# EAGLE schematic source_eagle (EAGLE 9.6.2)

## Sheet 1 of 2
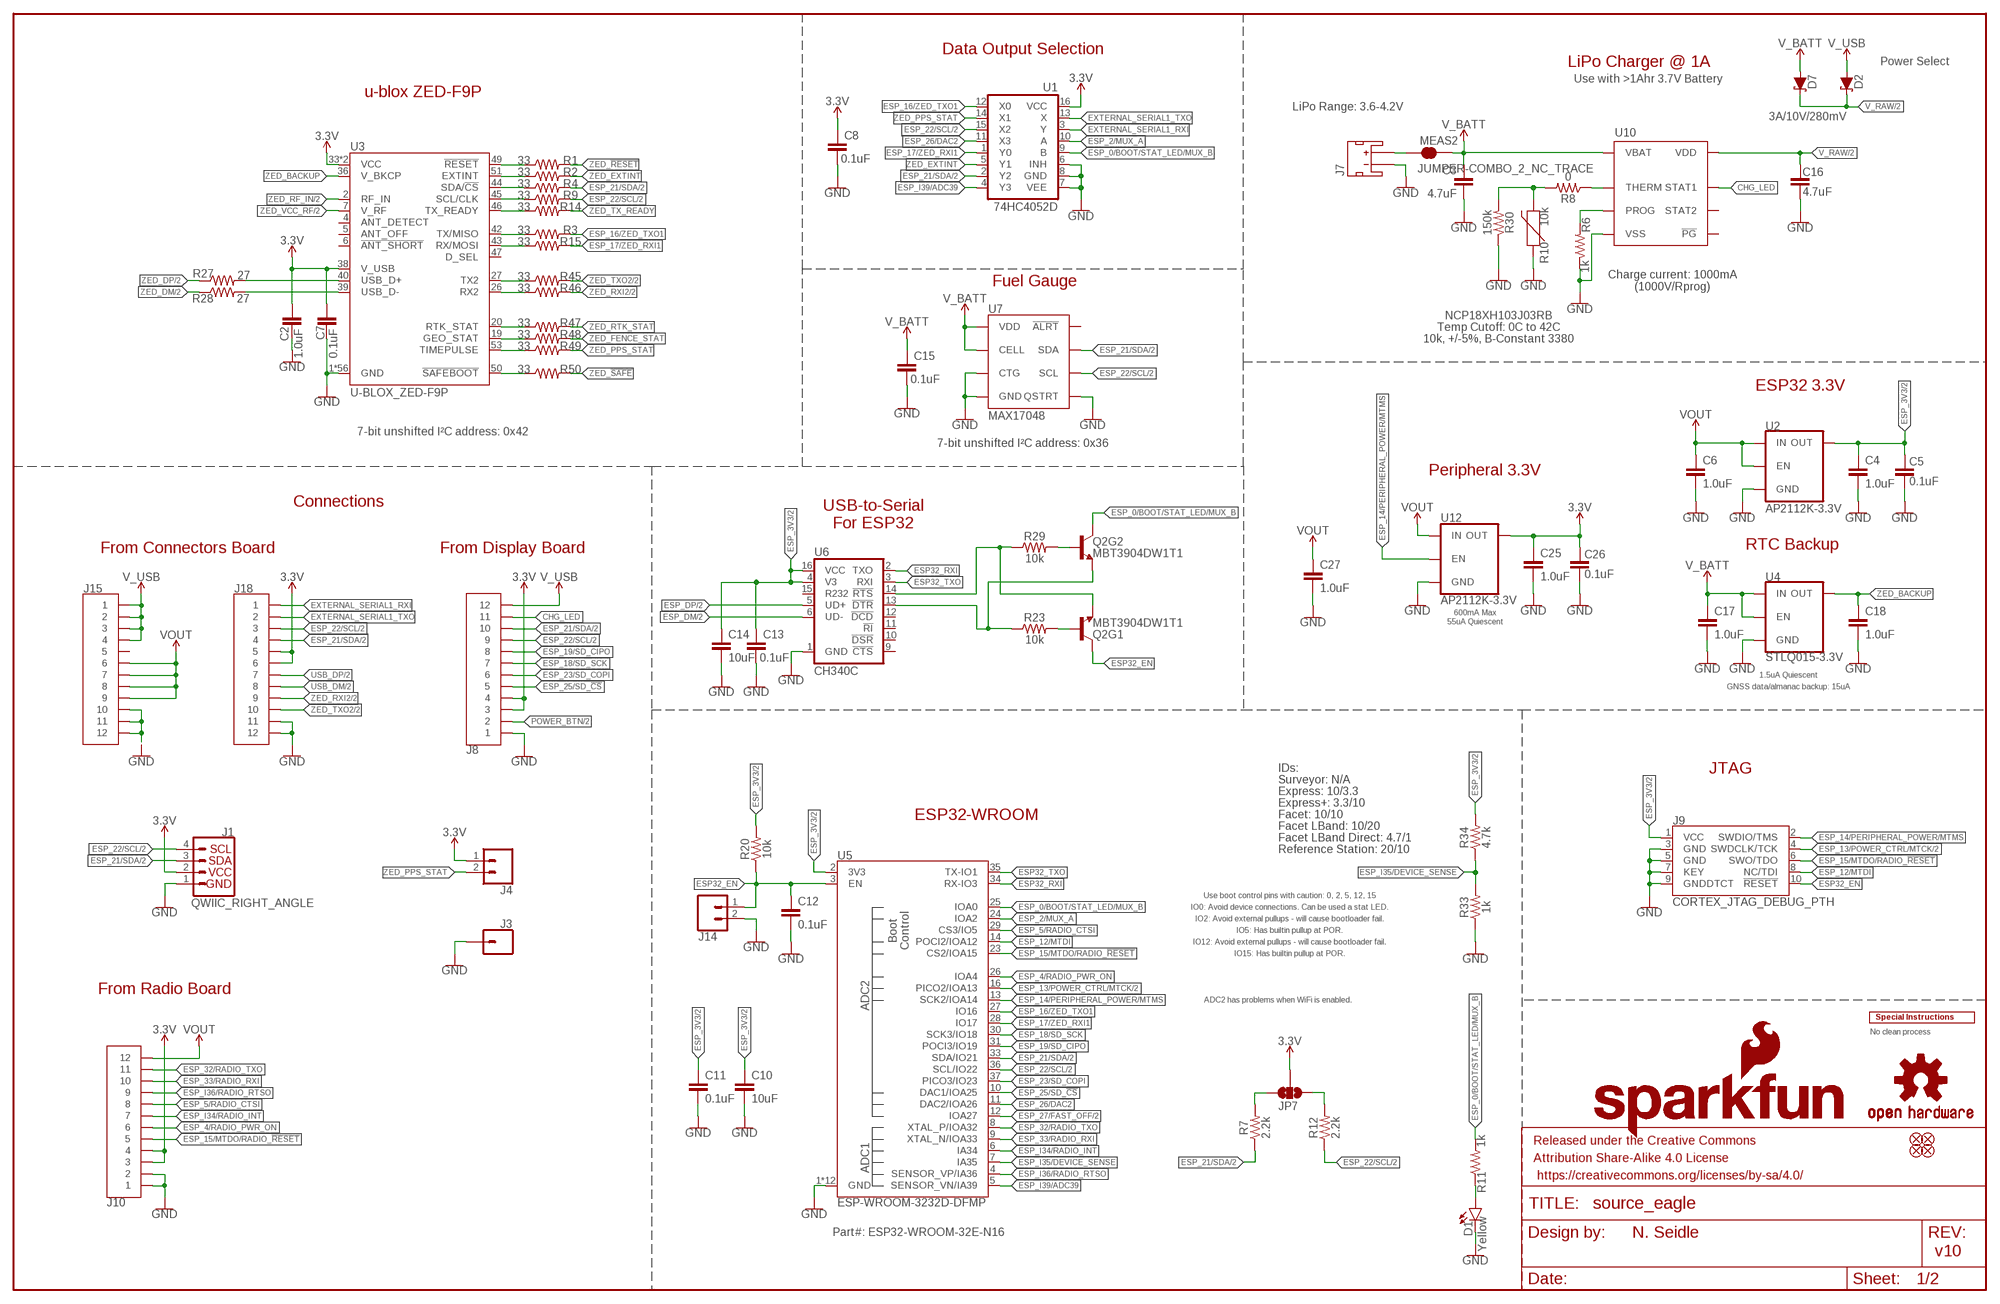
[diagram p0: schematic, sheet 1]

### Parts
C2  1.0uF  1.0UF-0603-16V-10%-X7R  [0603]
C3  4.7uF  4.7UF-0603-35V-(20%)  [0603]
C4  1.0uF  1.0UF-0603-16V-10%-X7R  [0603]
C5  0.1uF  0.1UF-0603-25V-5%  [0603]
C6  1.0uF  1.0UF-0603-16V-10%-X7R  [0603]
C7  0.1uF  0.1UF-0603-25V-5%  [0603]
C8  0.1uF  0.1UF-0603-25V-(+80/-20%)  [0603]
C10  10uF  10UF-0603-6.3V-20%  [0603]
C11  0.1uF  0.1UF-0603-25V-(+80/-20%)  [0603]
C12  0.1uF  0.1UF-0603-25V-(+80/-20%)  [0603]
C13  0.1uF  0.1UF-0603-25V-(+80/-20%)  [0603]
C14  10uF  10UF-0603-6.3V-20%  [0603]
C15  0.1uF  0.1UF-0603-25V-(+80/-20%)  [0603]
C16  4.7uF  4.7UF-0603-35V-(20%)  [0603]
C17  1.0uF  1.0UF-0603-16V-10%-X7R  [0603]
C18  1.0uF  1.0UF-0603-16V-10%-X7R  [0603]
C25  1.0uF  1.0UF-0603-16V-10%-X7R  [0603]
C26  0.1uF  0.1UF-0603-25V-5%  [0603]
C27  1.0uF  1.0UF-0603-16V-10%-X7R  [0603]
D1  Yellow  LED-YELLOW0603  [LED-0603]
D2  3A/10V/280mV  DIODE-SCHOTTKY-BAT60A  [SOD-323]
D7  3A/10V/280mV  DIODE-SCHOTTKY-BAT60A  [SOD-323]
FRAME2  FRAME-LEDGER  [CREATIVE_COMMONS]
J1  QWIIC_RIGHT_ANGLE  QWIIC_CONNECTORJS-1MM  [JST04_1MM_RA]
J3  CONN_01PTH_NO_SILK_YES_STOP  [1X01_NO_SILK]
J4  CONN_021X02_NO_SILK  [1X02_NO_SILK]
J7  JST_2MM_MALE  [JST-2-SMD]
J8  FPC_12_0.5MM_BACKFLIP  [FPC_12_DOUBLESIDED_BACKFLIP]
J9  CORTEX_JTAG_DEBUG_PTH  [2X5-PTH-1.27MM]
J10  FPC_12_0.5MM_BACKFLIP  [FPC_12_DOUBLESIDED_BACKFLIP]
J14  CONN_021X02_NO_SILK  [1X02_NO_SILK]
J15  FPC_12_0.5MM_BACKFLIP  [FPC_12_DOUBLESIDED_BACKFLIP]
J18  FPC_12_0.5MM_BACKFLIP  [FPC_12_DOUBLESIDED_BACKFLIP]
JP7  JUMPER-SMT_3_NO_SILK  [SMT-JUMPER_3_NO_SILK]
JP21  FIDUCIALUFIDUCIAL  [FIDUCIAL-MICRO]
JP61  FIDUCIALUFIDUCIAL  [FIDUCIAL-MICRO]
JP71  FIDUCIALUFIDUCIAL  [FIDUCIAL-MICRO]
JP81  FIDUCIALUFIDUCIAL  [FIDUCIAL-MICRO]
LOGO1  OSHW-LOGOMINI  [OSHW-LOGO-MINI]
LOGO2  SFE_LOGO_NAME_FLAME.1_INCH  [SFE_LOGO_NAME_FLAME_.1]
MEAS2  JUMPER-COMBO_2_NC_TRACE  [COMBO-JUMPER_2_NC_TRACE]
Q2  MBT3904DW1T1  TRANS_NPN_DUAL-MBT3904DW1T1  [SC70-6]
R1  33  33OHM-0603-1/10W-1%  [0603]
R2  33  33OHM-0603-1/10W-1%  [0603]
R3  33  33OHM-0603-1/10W-1%  [0603]
R4  33  33OHM-0603-1/10W-1%  [0603]
R6  1k  1KOHM-0603-1/10W-1%  [0603]
R7  2.2k  2.2KOHM-0603-1/10W-1%  [0603]
R8  0  0OHM-0603-1/10W  [0603]
R9  33  33OHM-0603-1/10W-1%  [0603]
R10  10k  NTC-THERMISTOR-0603  [0603]
R11  1k  1KOHM-0603-1/10W-1%  [0603]
R12  2.2k  2.2KOHM-0603-1/10W-1%  [0603]
R14  33  33OHM-0603-1/10W-1%  [0603]
R15  33  33OHM-0603-1/10W-1%  [0603]
R20  10k  10KOHM-0603-1/10W-1%  [0603]
R23  10k  10KOHM-0603-1/10W-1%  [0603]
R27  27  27OHM-0603-1/10W-1%  [0603]
R28  27  27OHM-0603-1/10W-1%  [0603]
R29  10k  10KOHM-0603-1/10W-1%  [0603]
R30  150k  150KOHM-0603-1/10W-1%  [0603]
R33  1k  1KOHM-0603-1/10W-1%  [0603]
R34  4.7k  4.7KOHM-0603-1/10W-1%  [0603]
R45  33  33OHM-0603-1/10W-1%  [0603]
R46  33  33OHM-0603-1/10W-1%  [0603]
R47  33  33OHM-0603-1/10W-1%  [0603]
R48  33  33OHM-0603-1/10W-1%  [0603]
R49  33  33OHM-0603-1/10W-1%  [0603]
R50  33  33OHM-0603-1/10W-1%  [0603]
U1  74HC4052D  [SO16]
U2  AP2112K-3.3V  V_REG_AP2112K-3.3V  [SOT23-5]
U3  U-BLOX_ZED-F9P  [ZED-F9P]
U4  STLQ015-3.3V  [SOT23-5]
U5  ESP-WROOM-3232D-DFMP  [ESP-WROOM-32D-DFM_PASTE]
U6  CH340C  [SO016]
U7  MAX17048  MAX17048DFN8  [DFN-8]
U10  MCP73833MSOP  [MSOP10]
U12  AP2112K-3.3V  V_REG_AP2112K-3.3V  [SOT23-5]
U$2  SPECIAL_INSTRUCTIONS-ORDERING  [ORDERING_INSTRUCTIONS]

### Nets
3.3V [power]: C2.1 C7.2 C8.1 C25.1 C26.2 J1.2 J4.1 J8.3 J8.4 J10.3 J10.4 J18.5 J18.6 JP7.2 U1.16(VCC) U3.33(VCC) U3.34(VCC) U3.38(V_USB) U12.5(OUT) ; also sheet 2
CHG_LED: J8.11 U10.3(STAT1)
CHG_THERM1: R8.2 R10.2 R30.2
ESP32_!DTR: Q2.1(E) R23.1 U6.13(!DTR)
ESP32_!RTS: Q2.4(E) R29.1 U6.14(!RTS)
ESP32_EN: C12.1 J9.10(!RESET) J14.1 Q2.3(C) R20.1 U5.3(EN)
ESP32_RXI: U5.34(RX-IO3) U6.2(TXO)
ESP32_TXO: U5.35(TX-IO1) U6.3(RXI)
ESP_0/BOOT/STAT_LED/MUX_B: Q2.6(C) R11.2 U1.9(B) U5.25(IOA0)
ESP_2/MUX_A: U1.10(A) U5.24(IOA2)
ESP_3V3 [power]: C4.1 C5.2 C10.1 C11.1 C13.1 C14.1 J9.1(VCC) R20.2 R34.2 U2.5(OUT) U5.2(3V3) U6.4(V3) U6.16(VCC) ; also sheet 2
ESP_4/RADIO_PWR_ON: J10.6 U5.26(IOA4)
ESP_5/RADIO_CTSI: J10.8 U5.29(CS3/IO5)
ESP_12/MTDI: J9.8(NC/TDI) U5.14(POCI2/IOA12)
ESP_13/POWER_CTRL/MTCK: J9.4(SWDCLK/TCK) U5.16(PICO2/IOA13) ; also sheet 2
ESP_14/PERIPHERAL_POWER/MTMS: J9.2(SWDIO/TMS) U5.13(SCK2/IOA14) U12.3(EN)
ESP_15/MTDO/RADIO_!RESET!: J9.6(SWO/TDO) J10.5 U5.23(CS2/IOA15)
ESP_16/ZED_TXO1: R3.2 U1.12(X0) U5.27(IO16)
ESP_17/ZED_RXI1: R15.2 U1.1(Y0) U5.28(IO17)
ESP_18/SD_SCK: J8.7 U5.30(SCK3/IO18)
ESP_19/SD_CIPO: J8.8 U5.31(POCI3/IO19)
ESP_21/SDA: J1.3 J8.10 J18.4 R4.2 R7.1 U1.2(Y2) U5.33(SDA/IO21) U7.8(SDA) ; also sheet 2
ESP_22/SCL: J1.4 J8.9 J18.3 R9.2 R12.1 U1.15(X2) U5.36(SCL/IO22) U7.7(SCL) ; also sheet 2
ESP_23/SD_COPI: J8.6 U5.37(PICO3/IO23)
ESP_25/SD_!CS!: J8.5 U5.10(DAC1/IOA25)
ESP_26/DAC2: U1.11(X3) U5.11(DAC2/IOA26)
ESP_27/FAST_OFF: U5.12(IOA27) ; also sheet 2
ESP_32/RADIO_TXO: J10.11 U5.8(XTAL_P/IOA32)
ESP_33/RADIO_RXI: J10.10 U5.9(XTAL_N/IOA33)
ESP_DM [USB]: U6.6(UD-) ; also sheet 2
ESP_DP [USB]: U6.5(UD+) ; also sheet 2
ESP_I34/RADIO_INT: J10.7 U5.6(IA34)
ESP_I35/DEVICE_SENSE: R33.2 R34.1 U5.7(IA35)
ESP_I36/RADIO_RTSO: J10.9 U5.4(SENSOR_VP/IA36)
ESP_I39/ADC39: U1.4(Y3) U5.5(SENSOR_VN/IA39)
EXTERNAL_SERIAL1_RXI: J18.1 U1.3(Y)
EXTERNAL_SERIAL1_TXO: J18.2 U1.13(X)
FENCE_LV: R48.1 U3.19(GEO_STAT)
GND: C2.2 C3.2 C4.2 C5.1 C6.2 C7.1 C8.2 C10.2 C11.2 C12.2 C13.2 C14.2 C15.2 C16.2 C17.2 C18.2 C25.2 C26.1 C27.2 D1.C J1.1 J3.1 J7.1(-) J8.1 J9.3(GND) J9.5(GND) J9.7(KEY) J9.9(GNDDTCT) J10.1 J10.2 J14.2 J15.10 J15.11 J15.12 J18.11 J18.12 R6.1 R10.1 R30.1 R33.1 U1.6(INH) U1.7(VEE) U1.8(GND) U2.2(GND) U3.1(GND) U3.3(GND) U3.12(GND) U3.14(GND) U3.32(GND) U3.37(GND) U3.41(GND) U3.48(GND) U3.55(GND) U3.56(GND) U3.57(GND) U3.58(GND) U3.59(GND) U3.60(GND) U3.61(GND) U3.62(GND) U3.63(GND) U3.64(GND) U3.65(GND) U3.66(GND) U3.67(GND) U3.68(GND) U3.69(GND) U3.70(GND) U3.71(GND) U3.72(GND) U3.73(GND) U3.74(GND) U3.75(GND) U3.76(GND) U3.77(GND) U3.78(GND) U3.79(GND) U3.80(GND) U3.81(GND) U3.82(GND) U3.83(GND) U3.84(GND) U3.85(GND) U3.86(GND) U3.87(GND) U3.88(GND) U3.89(GND) U3.90(GND) U3.91(GND) U3.92(GND) U3.93(GND) U3.94(GND) U3.95(GND) U3.96(GND) U3.97(GND) U3.98(GND) U3.99(GND) U3.100(GND) U3.101(GND) U3.102(GND) U4.2(GND) U5.1(GND) U5.15(GND) U5.38(GND) U5.GND U5.GNDT1(GND) U5.GNDT2(GND) U5.GNDT3(GND) U5.GNDT4(GND) U5.GNDT5(GND) U5.GNDT6(GND) U5.GNDT7(GND) U5.GNDT8(GND) U6.1(GND) U7.1(CTG) U7.4(GND) U7.6(QSTRT) U7.9(GND) U10.5(VSS) U12.2(GND) ; also sheet 2
LIPO_RAW: J7.2(+) MEAS2.1 MEAS2.3
N$1: R8.1 U10.8(THERM)
N$2: D1.A R11.1
N$3: JP7.3 R7.2
N$4: JP7.1 R12.2
N$5: R2.1 U3.51(EXTINT)
N$11 [USB]: R27.2 U3.40(USB_D+)
N$12 [USB]: R28.2 U3.39(USB_D-)
N$16: R1.1 U3.49(!RESET!)
N$18: R50.1 U3.50(!SAFEBOOT!)
N$22: R14.1 U3.46(TX_READY)
N$24: Q2.5(B) R23.2
N$25: Q2.2(B) R29.2
POWER_BTN: J8.2 ; also sheet 2
PPS: R49.1 U3.53(TIMEPULSE)
PROG1: R6.2 U10.6(PROG)
RTK_LV: R47.1 U3.20(RTK_STAT)
RX2_LV: R46.1 U3.26(RX2)
RXLV: R15.1 U3.43(RX/MOSI)
SCL_LV: R9.1 U3.45(SCL/CLK)
SDA_LV: R4.1 U3.44(SDA/!CS!)
TX2_LV: R45.1 U3.27(TX2)
TXLV: R3.1 U3.42(TX/MISO)
USB_DM: J18.8 ; also sheet 2
USB_DP: J18.7 ; also sheet 2
V_BATT [power]: C3.1 C15.1 C17.1 D7.A MEAS2.2 MEAS2.4 U4.1(IN) U4.3(EN) U7.2(CELL) U7.3(VDD) U10.9(VBAT) U10.10(VBAT)
V_RAW [power]: C16.1 D2.C D7.C U10.1(VDD) U10.2(VDD) ; also sheet 2
V_USB [power]: D2.A J8.12 J15.1 J15.2 J15.3 J15.4 ; also sheet 2
VOUT [power]: C6.1 C27.1 J10.12 J15.6 J15.7 J15.8 J15.9 U2.1(IN) U2.3(EN) U12.1(IN) ; also sheet 2
ZED_!RESET!: R1.2
ZED_!SAFE!: R50.2
ZED_BACKUP: C18.1 U3.36(V_BKCP) U4.5(OUT)
ZED_DM [USB]: R28.1 ; also sheet 2
ZED_DP [USB]: R27.1 ; also sheet 2
ZED_EXTINT: R2.2 U1.5(Y1)
ZED_FENCE_STAT: R48.2
ZED_PPS_STAT: J4.2 R49.2 U1.14(X1)
ZED_RF_IN [RF]: U3.2(RF_IN) ; also sheet 2
ZED_RTK_STAT: R47.2
ZED_RXI2: J18.9 R46.2 ; also sheet 2
ZED_TX_READY: R14.2
ZED_TXO2: J18.10 R45.2 ; also sheet 2
ZED_VCC_RF [supply]: U3.7(V_RF) ; also sheet 2
Unconnected: J7.NC1(PAD1) J7.NC2(PAD2) J15.5 U3.4(ANT_DETECT) U3.5(ANT_OFF) U3.6(!ANT_SHORT!) U3.47(D_SEL) U6.9(!CTS) U6.10(!DSR) U6.11(!RI) U6.12(!DCD) U6.15(R232) U7.5(!ALRT) U10.4(STAT2) U10.7(!PG)

### Notes on the sheet
- Data Output Selection
- LiPo Charger @ 1A | Power Select
- Use with >1Ahr 3.7V Battery
- u-blox ZED-F9P
- LiPo Range: 3.6-4.2V
- Fuel Gauge
- Charge current: 1000mA
  (1000V/Rprog)
- NCP18XH103J03RB
- Temp Cutoff: 0C to 42C
- 10k, +/-5%, B-Constant 3380
- ESP32 3.3V
- 7-bit unshifted I²C address: 0x42
- 7-bit unshifted I²C address: 0x36
- Peripheral 3.3V
- Connections
- USB-to-Serial
  For ESP32
- From Connectors Board | From Display Board | RTC Backup
- 600mA Max
  55uA Quiescent
- 1.5uA Quiescent
- GNSS data/almanac backup: 15uA
- IDs: | JTAG
- Surveyor: N/A
- Express: 10/3.3
- Express+: 3.3/10
- ESP32-WROOM | Facet: 10/10
- Facet LBand: 10/20
- Facet LBand Direct: 4.7/1
- Reference Station: 20/10
- Use boot control pins with caution: 0, 2, 5, 12, 15
- IO0: Avoid device connections. Can be used a stat LED.
- IO2: Avoid external pullups - will cause bootloader fail.
- IO5: Has builtin pullup at POR.
- IO12: Avoid external pullups - will cause bootloader fail.
- IO15: Has builtin pullup at POR.
- From Radio Board
- ADC2 has problems when WiFi is enabled.
- No clean process
- Part#: ESP32-WROOM-32E-N16
- N. Seidle
- v10

## Sheet 2 of 2
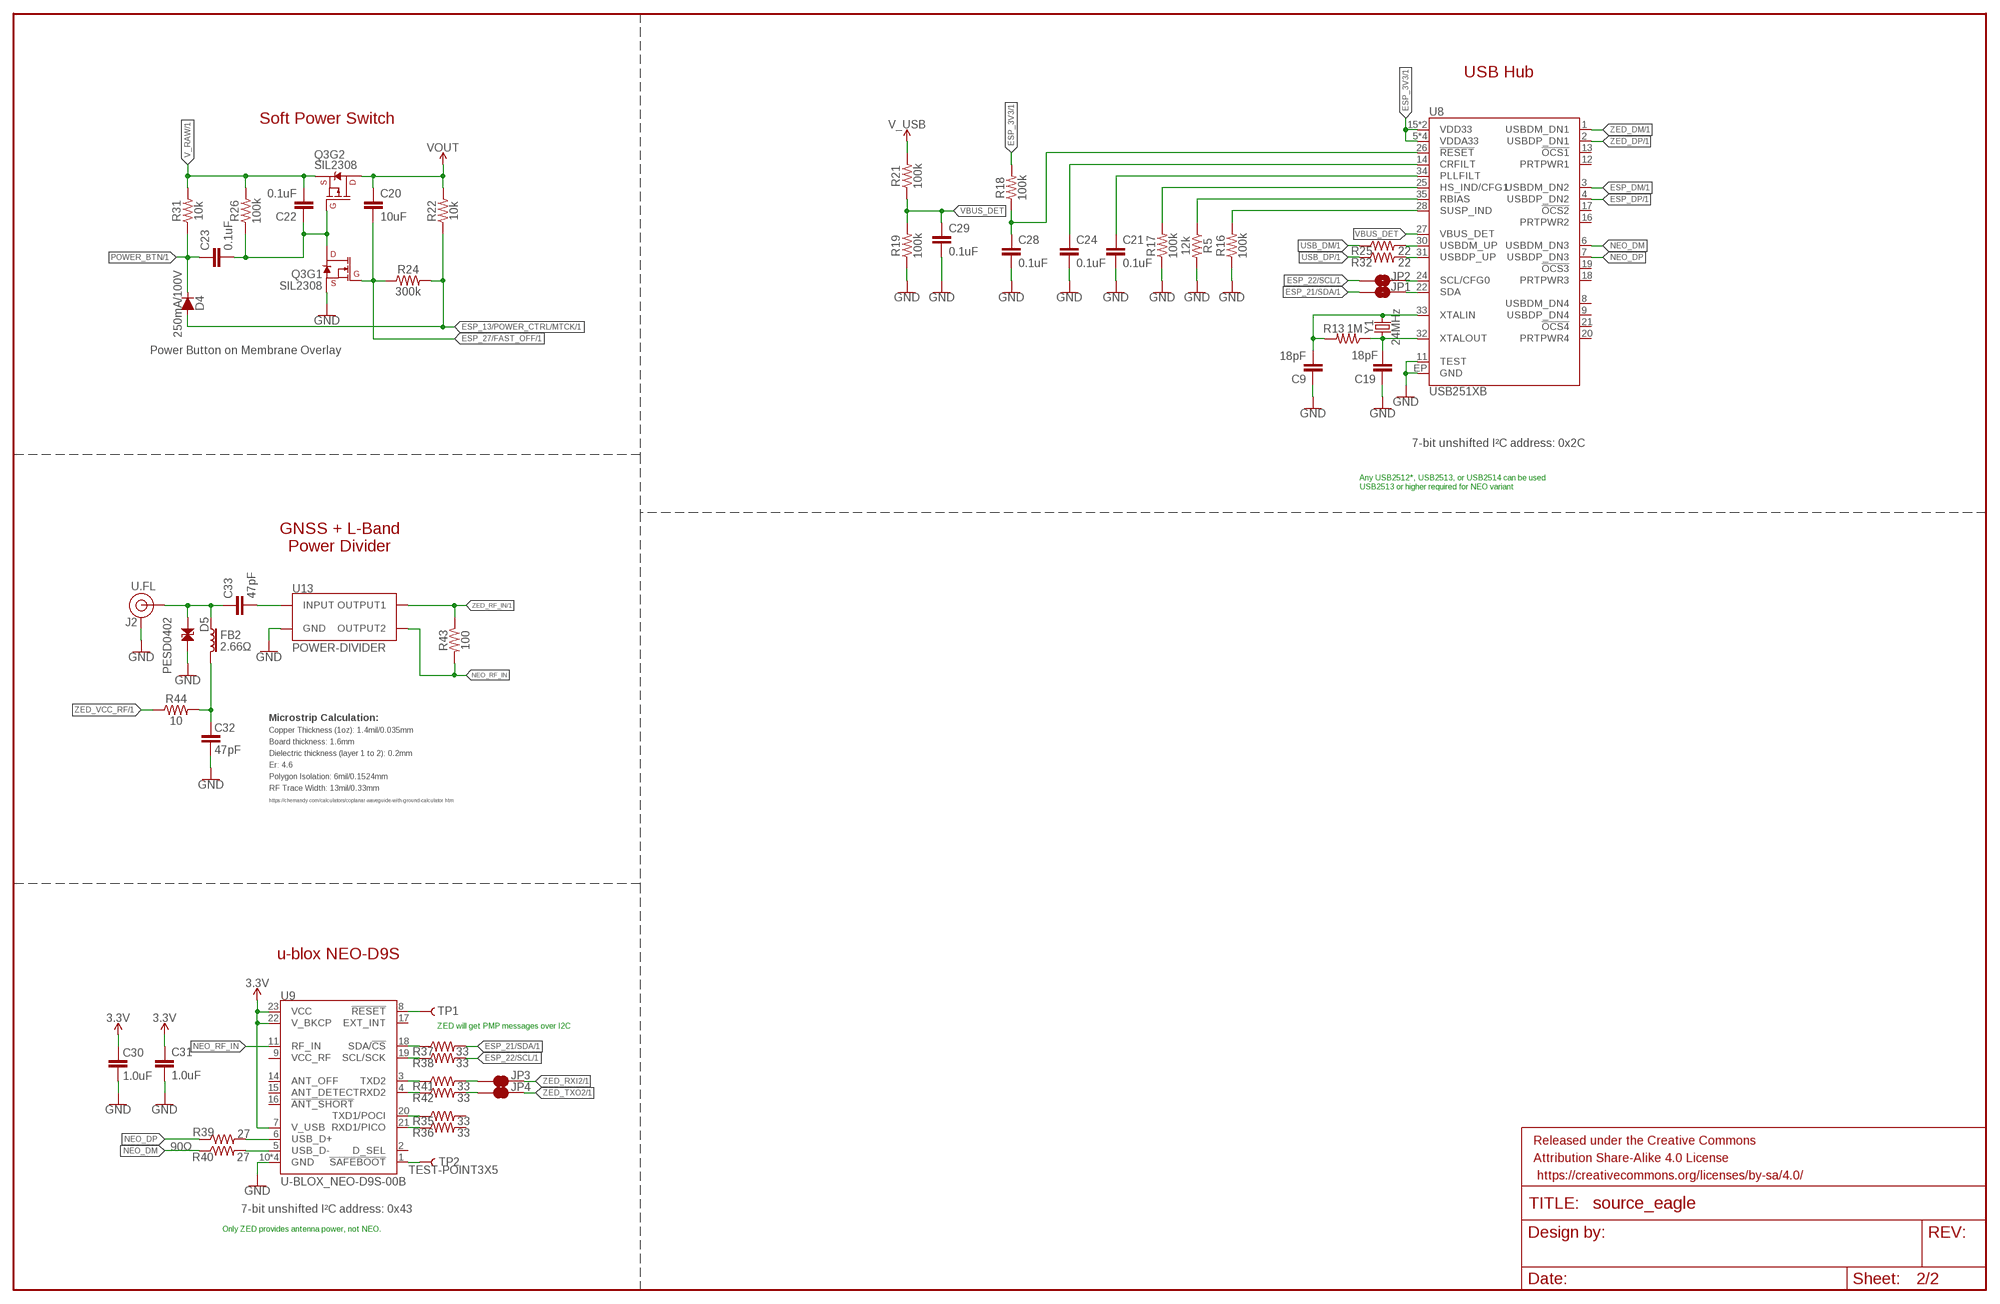
[diagram p1: schematic, sheet 2]

### Parts
C9  18pF  18PF-0603-50V-5%  [0603]
C19  18pF  18PF-0603-50V-5%  [0603]
C20  10uF  10UF-0603-6.3V-20%  [0603]
C21  0.1uF  0.1UF-0603-25V-5%  [0603]
C22  0.1uF  0.1UF-0603-25V-5%  [0603]
C23  0.1uF  0.1UF-0603-25V-5%  [0603]
C24  0.1uF  0.1UF-0603-25V-5%  [0603]
C28  0.1uF  0.1UF-0603-25V-5%  [0603]
C29  0.1uF  0.1UF-0603-25V-5%  [0603]
C30  1.0uF  1.0UF-0603-16V-10%  [0603]
C31  1.0uF  1.0UF-0603-16V-10%  [0603]
C32  47pF  47PF-0402_TIGHT-25V-5%-X7R  [0402-TIGHT]
C33  47pF  47PF-0402_TIGHT-25V-5%-X7R  [0402-TIGHT]
D4  250mA/100V  DIODE-BAS16J  [SOD-323]
D5  PESD0402  PESD0402-0402T  [0402-TIGHT]
FB2  2.66Ω  FERRITE_BEAD-0402-2.66Ω-1GHZ  [0402-TIGHT]
FRAME1  FRAME-LEDGER  [CREATIVE_COMMONS]
J2  U.FL  U.FL2PIN  [U.FL]
JP1  JUMPER-SMT_2_NO_SILK  [SMT-JUMPER_2_NO_SILK]
JP2  JUMPER-SMT_2_NO_SILK  [SMT-JUMPER_2_NO_SILK]
JP3  JUMPER-SMT_2_NC_TRACE_SILK  [SMT-JUMPER_2_NC_TRACE_SILK]
JP4  JUMPER-SMT_2_NC_TRACE_SILK  [SMT-JUMPER_2_NC_TRACE_SILK]
Q3  SIL2308  MOSFET_COMPLIMENTARY_PAIR-SIL2308  [SOT26]
R5  12k  12KOHM-0603-1/10W-1%  [0603]
R13  1M  1MOHM-0603-1/4W-5%  [0603]
R16  100k  100KOHM-0603-1/10W-1%  [0603]
R17  100k  100KOHM-0603-1/10W-1%  [0603]
R18  100k  100KOHM-0603-1/10W-1%  [0603]
R19  100k  100KOHM-0603-1/10W-1%  [0603]
R21  100k  100KOHM-0603-1/10W-1%  [0603]
R22  10k  10KOHM-0603-1/10W-1%  [0603]
R24  300k  300KOHM-0603-1/10W-1%  [0603]
R25  22  22OHM-0603-1/10W-1%  [0603]
R26  100k  100KOHM-0603-1/10W-1%  [0603]
R31  10k  10KOHM-0603-1/10W-1%  [0603]
R32  22  22OHM-0603-1/10W-1%  [0603]
R35  33  33OHM-0603-1/10W-1%  [0603]
R36  33  33OHM-0603-1/10W-1%  [0603]
R37  33  33OHM-0603-1/10W-1%  [0603]
R38  33  33OHM-0603-1/10W-1%  [0603]
R39  27  27OHM-0603-1/10W-1%  [0603]
R40  27  27OHM-0603-1/10W-1%  [0603]
R41  33  33OHM-0603-1/10W-1%  [0603]
R42  33  33OHM-0603-1/10W-1%  [0603]
R43  100  100OHM-0603-1/10W-1%  [0603]
R44  10  10OHM-0402-1/16W-5%  [0402-TIGHT]
TP1  TEST-POINT3X5  [PAD.03X.05]
TP2  TEST-POINT3X5  [PAD.03X.05]
U8  USB251XB  [QFN-36]
U9  U-BLOX_NEO-D9S-00B  [NEO-M9N/M8T/M8U/D9S/F9P]
U13  POWER-DIVIDER  [PD0922J5050S2HF_ANA]
Y1  24MHz  CRYSTAL-24MHZ-SMD-2.0X1.6MM  [CRYSTAL-SMD-2.0X1.6MM]

### Nets
3.3V [power]: C30.1 C31.1 U9.7(V_USB) U9.22(V_BKCP) U9.23(VCC) ; also sheet 1
ESP_3V3 [power]: R18.2 U8.5(VDDA33) U8.10(VDDA33) U8.15(VDD33) U8.23(VDD33) U8.29(VDDA33) U8.36(VDDA33) ; also sheet 1
ESP_13/POWER_CTRL/MTCK: D4.A R22.1 R24.2 ; also sheet 1
ESP_21/SDA: JP1.1 R37.2 ; also sheet 1
ESP_22/SCL: JP2.1 R38.2 ; also sheet 1
ESP_27/FAST_OFF: C20.2 Q3.G1(G) R24.1 ; also sheet 1
ESP_DM [USB]: U8.3(USBDM_DN2) ; also sheet 1
ESP_DP [USB]: U8.4(USBDP_DN2) ; also sheet 1
GND: C9.1 C19.1 C21.2 C24.2 C28.2 C29.2 C30.2 C31.2 C32.2 D5.2 J2.1(GND) J2.2(GND) Q3.S1(S) R5.2 R16.1 R17.1 R19.1 U8.11(TEST) U8.EP(GND) U9.10(GND) U9.12(GND) U9.13(GND) U9.24(GND) U13.1(GND) U13.3(GND) U13.5(GND) ; also sheet 1
N$6: C22.1 C23.2 Q3.D1(D) Q3.G2(G) R26.1
N$7: C9.2 R13.2 U8.33(XTALIN) Y1.3
N$8: C19.2 R13.1 U8.32(XTALOUT) Y1.1
N$9: R5.1 U8.35(RBIAS)
N$10: R16.2 U8.28(SUSP_IND)
N$13: JP3.1 R41.2
N$14: R17.2 U8.25(HS_IND/CFG1)
N$15: C21.1 U8.34(PLLFILT)
N$17: C24.1 U8.14(CRFILT)
N$19: R25.2 U8.30(USBDM_UP)
N$20: R32.2 U8.31(USBDP_UP)
N$21: JP1.2 U8.22(SDA)
N$23: JP2.2 U8.24(SCL/CFG0)
N$26 [USB]: R39.2 U9.6(USB_D+)
N$27 [USB]: R40.2 U9.5(USB_D-)
N$28: R41.1 U9.3(TXD2)
N$29: R42.1 U9.4(RXD2)
N$30: R35.1 U9.20(TXD1/POCI)
N$31: R36.1 U9.21(RXD1/PICO)
N$32: R37.1 U9.18(SDA/!CS!)
N$33: R38.1 U9.19(SCL/SCK)
N$34: C32.1 FB2.2 R44.2
N$35: JP4.1 R42.2
N$48 [RF]: C33.2 U13.2(INPUT)
NEO_!RESET!: TP1.1 U9.8(!RESET!)
NEO_!SAFEBOOT!: TP2.1 U9.1(!SAFEBOOT!)
NEO_DM [USB]: R40.1 U8.6(USBDM_DN3)
NEO_DP [USB]: R39.1 U8.7(USBDP_DN3)
NEO_RF_IN [RF]: R43.2 U9.11(RF_IN) U13.6(OUTPUT2)
POWER_BTN: C23.1 D4.C R31.1 ; also sheet 1
RF_IN [RF]: C33.1 D5.1 FB2.1 J2.FEED(SIGNAL)
USB_!RESET: C28.1 R18.1 U8.26(!RESET)
USB_DM: R25.1 ; also sheet 1
USB_DP: R32.1 ; also sheet 1
V_RAW [power]: C22.2 Q3.S2(S) R26.2 R31.2 ; also sheet 1
V_USB [power]: R21.2 ; also sheet 1
VBUS_DET: C29.1 R19.2 R21.1 U8.27(VBUS_DET)
VOUT [power]: C20.1 Q3.D2(D) R22.2 ; also sheet 1
ZED_DM [USB]: U8.1(USBDM_DN1) ; also sheet 1
ZED_DP [USB]: U8.2(USBDP_DN1) ; also sheet 1
ZED_RF_IN [RF]: R43.1 U13.4(OUTPUT1) ; also sheet 1
ZED_RXI2: JP3.2 ; also sheet 1
ZED_TXO2: JP4.2 ; also sheet 1
ZED_VCC_RF [supply]: R44.1 ; also sheet 1
Unconnected: R35.2 R36.2 U8.8(USBDM_DN4) U8.9(USBDP_DN4) U8.12(PRTPWR1) U8.13(!OCS1) U8.16(PRTPWR2) U8.17(!OCS2) U8.18(PRTPWR3) U8.19(!OCS3) U8.20(PRTPWR4) U8.21(!OCS4) U9.2(D_SEL) U9.9(VCC_RF) U9.14(ANT_OFF) U9.15(ANT_DETECT) U9.16(!ANT_SHORT!) U9.17(EXT_INT)

### Notes on the sheet
- USB Hub
- Soft Power Switch
- Power Button on Membrane Overlay
- 7-bit unshifted I²C address: 0x2C
- Any USB2512*, USB2513, or USB2514 can be used
  USB2513 or higher required for NEO variant
- GNSS + L-Band
  Power Divider
- Microstrip Calculation:
- Copper Thickness (1oz): 1.4mil/0.035mm
- Board thickness: 1.6mm
- Dielectric thickness (layer 1 to 2): 0.2mm
- Er: 4.6
- Polygon Isolation: 6mil/0.1524mm
- RF Trace Width: 13mil/0.33mm
- https://chemandy.com/calculators/coplanar-waveguide-with-ground-calculator.htm
- u-blox NEO-D9S
- ZED will get PMP messages over I2C
- 90Ω
- 7-bit unshifted I²C address: 0x43
- Only ZED provides antenna power, not NEO.

## Library data of the parts
C2 C4 C6 C17 C18 C25 C27 = SparkFun-Capacitors:1.0UF: 1µF ceramic capacitors A capacitor is a passive two-terminal electrical component used to store electrical energy temporarily in an electric field.; PROD_ID: CAP-13930
C3 C16 = SparkFun-Capacitors:4.7UF: 4.7µF ceramic capacitors A capacitor is a passive two-terminal electrical component used to store electrical energy temporarily in an electric field.; PROD_ID: CAP-14106
C5 C7 C21-C24 C26 C28 C29 = SparkFun-Capacitors:0.1UF: 0.1µF ceramic capacitors A capacitor is a passive two-terminal electrical component used to store electrical energy temporarily in an electric field.; PROD_ID: CAP-08604
C8 C11-C13 C15 = SparkFun-Capacitors:0.1UF: 0.1µF ceramic capacitors A capacitor is a passive two-terminal electrical component used to store electrical energy temporarily in an electric field.; PROD_ID: CAP-00810
C9 C19 = SparkFun-Capacitors:18PF: 18pF ceramic capacitors A capacitor is a passive two-terminal electrical component used to store electrical energy temporarily in an electric field.; PROD_ID: CAP-08267
C10 C14 C20 = SparkFun-Capacitors:10UF: 10.0µF ceramic capacitors A capacitor is a passive two-terminal electrical component used to store electrical energy temporarily in an electric field.; PROD_ID: CAP-11015
C30 C31 = SparkFun-Capacitors:1.0UF: 1µF ceramic capacitors A capacitor is a passive two-terminal electrical component used to store electrical energy temporarily in an electric field.; PROD_ID: CAP-00868
C32 C33 = SparkFun-Capacitors:47PF: 47pF ceramic capacitors A capacitor is a passive two-terminal electrical component used to store electrical energy temporarily in an electric field.; PROD_ID: CAP-15063
D1 = SparkFun-LED:LED-YELLOW: Yellow SMD LED Used in manufacturing several products at SparkFun. Packages: 0603 - SMD 0603 package[Product Link] <http://www.kingbrightusa.com/product.asp?catalog_name=LED&product_id=APT1608SYCK> 0603 -SMART - SMART SMD 0603 package (more efficient/more expensive) [Product Link] <http://www.osram-os.com/osram_os/en/products/product-catalog/led-light-emitting-diodes/smartled-0603/ly-l29k/index.jsp> LilyPad - SMD1206 package[Product Datasheet] <https://www.sparkfun.com/datasheets/DevTools/LilyPad/Q150YUS4.pdf> SparkFun Products: Blynk Board <https://www.sparkfun.com/products/13794> IOIO-OTG <https://www.sparkfun.com/products/13613> XBee Explorer Serial <https://www.sparkfun.com/products/13225>; PROD_ID: DIO-09003
D2 D7 = SparkFun-DiscreteSemi:DIODE-SCHOTTKY: Schottky diode A Schottky diode is a semiconductor diode which has a low forward voltage drop and a very fast switching action.; PROD_ID: DIO-14072
D4 = SparkFun-DiscreteSemi:DIODE: Diode These are standard reverse protection diodes and small signal diodes. SparkFun Products: SparkFun SparkPunk Sound Kit <https://www.sparkfun.com/products/11177> SparkFun ESP8266 Thing <https://www.sparkfun.com/products/13231>; PROD_ID: DIO-09646
D5 = SparkFun-DiscreteSemi:PESD0402: ESD protection diode PESD is used to protect a signal line from ESD.; PROD_ID: DIO-15359
FB2 = SparkFun-Coils:FERRITE_BEAD: Ferrite Bead (blocks, cores, rings, chokes, etc.) Inductor with layers of ferrite used to suppress high frequencies. Often used to isolate high frequency noise. SparkFun Products: IOIO-OTG - V2.2 SparkFun SAMD21 Mini Breakout SparkFun 6 Degrees of Freedom Breakout - LSM6DS3 SparkFun SAMD21 Dev Breakout Lilypad MP3; PROD_ID: NDUC-15072
FRAME1 FRAME2 = SparkFun-Aesthetics:FRAME-LEDGER: Schematic Frame - Ledger Standard 11x14 US Ledger frame
J1 = SparkFun-Connectors:QWIIC_CONNECTOR: SparkFun I2C Standard Qwiic Connector An SMD 1mm pitch JST connector makes it easy and quick (get it? Qwiic?) to connect I2C devices to each other. The Qwiic system <http://www.sparkfun.com/qwiic> enables fast and solderless connection between popular platforms and various sensors and actuators. We carry 200mm <https://www.sparkfun.com/products/14204>, 100mm <https://www.sparkfun.com/products/14205>, 50mm <https://www.sparkfun.com/products/14206>, and breadboard friendly <https://www.sparkfun.com/products/14207> Qwiic cables. We also offer 10 pcs strips <https://www.sparkfun.com/products/14323> the SMD connectors.; PROD_ID: CONN-13694
J2 = SparkFun-Connectors:U.FL2PIN: SMD Antenna Connector - U.FL 2mm height, 3.0mm x 3.0mm receptacle size. SparkFun Products: SparkFun WiFi Shield - ESP8266 <https://www.sparkfun.com/products/13287> SparkFun ESP8266 Thing <https://www.sparkfun.com/products/13231> SparkFun MiniGen - Pro Mini Signal Generator Shield <https://www.sparkfun.com/products/11420>; PROD_ID: CONN-09193; SF_ID: WRL-09144
J3 = SparkFun-Connectors:CONN_01: Single connection point. Often used as Generic Header-pin footprint for 0.1 inch spaced/style header connections On any of the 0.1 inch spaced packages, you can populate with these: Break Away Headers - Straight (PRT-00116) Break Away Male Headers - Right Angle (PRT-00553) Female Headers (PRT-00115) Break Away Headers - Machine Pin (PRT-00117) Break Away Female Headers - Swiss Machine Pin (PRT-00743) This device is also useful as a general connection point to wire up your design to another part of your project. Our various solder wires solder well into these plated through hole pads. Hook-Up Wire - Assortment (Stranded, 22 AWG) (PRT-11375) Hook-Up Wire - Assortment (Solid Core, 22 AWG) (PRT-11367) View the entire wire category on our website here Special notes: SMTSO-256-ET is a "flush mount" nut for a 4-40 screw. We mostly use this on specialty testbeds; it is a nice way to connect hardware to your PCB at an adjustable hieght. Also note, the SNAP packages are for using a snappable style connector. We sell a baggie of snaps and they are also used on two LilyPad designs: Snap Assortment - 30 pack (male and female) (DEV-11347) LilyPad Arduino SimpleSnap (DEV-10941) LilyPad SimpleSnap Protoboard (DEV-10940)
J4 J14 = SparkFun-Connectors:CONN_02: Multi connection point. Often used as Generic Header-pin footprint for 0.1 inch spaced/style header connections On any of the 0.1 inch spaced packages, you can populate with these: Break Away Headers - Straight (PRT-00116) Break Away Male Headers - Right Angle (PRT-00553) Female Headers (PRT-00115) Break Away Headers - Machine Pin (PRT-00117) Break Away Female Headers - Swiss Machine Pin (PRT-00743) For SCREWTERMINALS and SPRING TERMINALS visit here: Screw Terimnals on SparkFun.com (5mm/3.5mm/2.54mm spacing) This device is also useful as a general connection point to wire up your design to another part of your project. Our various solder wires solder well into these plated through hole pads. Hook-Up Wire - Assortment (Stranded, 22 AWG) (PRT-11375) Hook-Up Wire - Assortment (Solid Core, 22 AWG) (PRT-11367) View the entire wire category on our website here Special notes: Molex polarized connector foot print use with: PRT-08233 with associated crimp pins and housings. 2.54_SCREWTERM for use with PRT-10571. 3.5mm Screw Terminal footprints for PRT-08084 5mm Screw Terminal footprints for use with PRT-08432
J7 = SparkFun-Connectors:JST_2MM_MALE: JST 2MM MALE RA CONNECTOR Two pin, compact surface mount connector. Commonly used as a battery input connection point. We really like the solid locking feeling and high current rating on these small connectors. We use these all the time as battery connectors. Mates to single-cell LiPo batteries. Here is the connector we sell at SparkFun: JST Right Angle Connector - White (PRT-08612) Datasheet It was used on these SparkFun products: SparkFun MOSFET Power Controller (PRT-11214) SparkFun Battery Babysitter - LiPo Battery Manager (PRT-13777) And many, many others that required a lipo battery connection.; PROD_ID: CONN-11443; SF_ID: PRT-08612
J8 J10 J15 J18 = RTK Facet:FPC_12_0.5MM; PROD_ID: CONN-15766
J9 = SparkFun-Connectors:CORTEX_JTAG_DEBUG: Cortex Debug Connector - 10 pin Supports JTAG debug, Serial Wire debug, and Serial Wire Viewer. PTH and SMD connector options available. General Connector Information <http://infocenter.arm.com/help/topic/com.arm.doc.faqs/attached/13634/cortex_debug_connectors.pdf> Products: PTH Connector <http://www.digikey.com/product-detail/en/cnc-tech/3220-10-0100-00/1175-1627-ND/3883661> -via Digi-Key SparkFun PSoc <https://www.sparkfun.com/products/13229> SparkFun T <https://www.sparkfun.com/products/13810>
JP1 JP2 = SparkFun-Jumpers:JUMPER-SMT_2_NO: Normally open jumper This jumper has two pads in close proximity to each other. Apply solder to close the connection. Round pads are easier to solder for beginners, but are a lot larger. SparkFun Product that uses the round pads: SparkFun EL Sequencer
JP3 JP4 = SparkFun-Jumpers:JUMPER-SMT_2_NC_TRACE: Normally closed trace jumper This jumper has a trace between two pads so it's normally closed (NC). Use a razor knife to open the connection. For best results follow the IPC guidelines for cutting traces: Cutout at least 0.063 mm (0.005 in). Remove all loose material to clean up the cut area. Seal the cut with an approved epoxy. Reapply solder to reclose the connection.
JP7 = SparkFun-Jumpers:JUMPER-SMT_3_NO: Normally open jumper This jumper has three pads in close proximity to each other. Apply solder to close the connection(s).
JP21 JP61 JP71 JP81 = SparkFun-Aesthetics:FIDUCIAL: Fiducial Alignment Points Point-of-reference for pick-and-place machines and other optical instruments.
LOGO1 = SparkFun-Aesthetics:OSHW-LOGO: Open-Source Hardware (OSHW) Logo This logo indicates the piece of hardware it is found on incorporates a OSHW license and/or adheres to the definition of open source hardware found here: http://freedomdefined.org/OSHW
LOGO2 = SparkFun-Aesthetics:SFE_LOGO_NAME_FLAME: SparkFun Font Logo w/ Flame This is the SparkFun full logo. The logo on the schematic will always be the same size; the package variant is the height of the flame part of the logo. Default layer for the logo on the board is tSilk.
MEAS2 = SparkFun-Jumpers:JUMPER-COMBO_2_NC_TRACE
Q2 = SparkFun-DiscreteSemi:TRANS_NPN_DUAL: Dual NPN Transistors in Single Package The MBT3904W1 puts two general purpose 3904 NPN transistors in a single package. Datasheet <http://www.onsemi.com/pub_link/Collateral/MBT3904DW1T1-D.PDF> SparkFun Products: SparkFun ESP32 Thing <https://www.sparkfun.com/products/13907>; PROD_ID: TRANS-13337
Q3 = SparkFun-DiscreteSemi:MOSFET_COMPLIMENTARY_PAIR: Complementary pair enhancement mode MOSFET 1A and 4A A P and N channel MOSFET in a single package. Rated to breakdown at 20V. DMC2700 is 1A. SIL2308 is 4A. Link to datasheet <http://www.diodes.com/_files/datasheets/DMC2700UDM.pdf> SparkFun Products: ZX Distance and Gesture Sensor <https://www.sparkfun.com/products/12780>; PROD_ID: TRANS-15717
R1-R4 R9 R14 R15 R35-R38 R41 R42 R45-R50 = SparkFun-Resistors:33OHM: 33Ω resistor A resistor is a passive two-terminal electrical component that implements electrical resistance as a circuit element. Resistors act to reduce current flow, and, at the same time, act to lower voltage levels within circuits. - Wikipedia; PROD_ID: RES-08270
R5 = SparkFun-Resistors:12KOHM: 12kΩ resistor A resistor is a passive two-terminal electrical component that implements electrical resistance as a circuit element. Resistors act to reduce current flow, and, at the same time, act to lower voltage levels within circuits. - Wikipedia; PROD_ID: RES-10327
R6 R11 R33 = SparkFun-Resistors:1KOHM: 1kΩ resistor A resistor is a passive two-terminal electrical component that implements electrical resistance as a circuit element. Resistors act to reduce current flow, and, at the same time, act to lower voltage levels within circuits. - Wikipedia; PROD_ID: RES-07856
R7 R12 = SparkFun-Resistors:2.2KOHM: 2.2kΩ resistor A resistor is a passive two-terminal electrical component that implements electrical resistance as a circuit element. Resistors act to reduce current flow, and, at the same time, act to lower voltage levels within circuits. - Wikipedia; PROD_ID: RES-08272
R8 = SparkFun-Resistors:0OHM: 0Ω resistor A resistor is a passive two-terminal electrical component that implements electrical resistance as a circuit element. Resistors act to reduce current flow, and, at the same time, act to lower voltage levels within circuits. - Wikipedia; PROD_ID: RES-08609
R10 = SparkFun-Resistors:NTC-THERMISTOR: NTC Thermistor An NTC thermistor's resistance decreases as temperature rises. Applications: Resistance Thermometer - temperature monitoring Inrush current limiter Heat source; PROD_ID: RES-13608
R13 = SparkFun-Resistors:1MOHM: 1MΩ resistor A resistor is a passive two-terminal electrical component that implements electrical resistance as a circuit element. Resistors act to reduce current flow, and, at the same time, act to lower voltage levels within circuits. - Wikipedia; PROD_ID: RES-07868
R16-R19 R21 R26 = SparkFun-Resistors:100KOHM: 100kΩ resistor A resistor is a passive two-terminal electrical component that implements electrical resistance as a circuit element. Resistors act to reduce current flow, and, at the same time, act to lower voltage levels within circuits. - Wikipedia; PROD_ID: RES-07828
R20 R22 R23 R29 R31 = SparkFun-Resistors:10KOHM: 10kΩ resistor A resistor is a passive two-terminal electrical component that implements electrical resistance as a circuit element. Resistors act to reduce current flow, and, at the same time, act to lower voltage levels within circuits. - Wikipedia; PROD_ID: RES-00824
R24 = SparkFun-Resistors:300KOHM: 300kΩ resistor A resistor is a passive two-terminal electrical component that implements electrical resistance as a circuit element. Resistors act to reduce current flow, and, at the same time, act to lower voltage levels within circuits. - Wikipedia; PROD_ID: RES-10809
R25 R32 = SparkFun-Resistors:22OHM: 22Ω resistor A resistor is a passive two-terminal electrical component that implements electrical resistance as a circuit element. Resistors act to reduce current flow, and, at the same time, act to lower voltage levels within circuits. - Wikipedia; PROD_ID: RES-08698; VALUE: 22Ω
R27 R28 R39 R40 = SparkFun-Resistors:27OHM: 27Ω resistor A resistor is a passive two-terminal electrical component that implements electrical resistance as a circuit element. Resistors act to reduce current flow, and, at the same time, act to lower voltage levels within circuits. - Wikipedia; PROD_ID: RES-09334
R30 = SparkFun-Resistors:150KOHM: 150kΩ resistor A resistor is a passive two-terminal electrical component that implements electrical resistance as a circuit element. Resistors act to reduce current flow, and, at the same time, act to lower voltage levels within circuits. - Wikipedia; PROD_ID: RES-09117
R34 = SparkFun-Resistors:4.7KOHM: 4.7kΩ resistor A resistor is a passive two-terminal electrical component that implements electrical resistance as a circuit element. Resistors act to reduce current flow, and, at the same time, act to lower voltage levels within circuits. - Wikipedia; PROD_ID: RES-07857
R43 = SparkFun-Resistors:100OHM: 100Ω resistor A resistor is a passive two-terminal electrical component that implements electrical resistance as a circuit element. Resistors act to reduce current flow, and, at the same time, act to lower voltage levels within circuits. - Wikipedia; PROD_ID: RES-07863
R44 = SparkFun-Resistors:10OHM: 10Ω resistor A resistor is a passive two-terminal electrical component that implements electrical resistance as a circuit element. Resistors act to reduce current flow, and, at the same time, act to lower voltage levels within circuits. - Wikipedia; PROD_ID: RES-16072; VALUE: 10Ω
TP1 TP2 = SparkFun-Connectors:TEST-POINT: SparkFun Test Points Bare copper test points for troubleshooting or In-Circuit-Testing. These are used by our Production team for verifying production board runs using pogo-pins on test beds. SparkFun Products: SparkFun LSM9DS1 Breakout <https://www.sparkfun.com/products/13284> SparkFun PSOC <https://www.sparkfun.com/products/13714> SparkFun Load Cell Amplifier <https://www.sparkfun.com/products/13879>
U1 = SparkFun-IC-Logic:74*4052: Dual 4:1 Analog Mux Dual four-channel analog MULTIPLEXER / DEMULTIPLEXER SparkFun Products SparkFun Vernier Interface Shield (DEV-12858); PROD_ID: IC-13103
U2 U12 = SparkFun-IC-Power:V_REG_AP2112: AP2112 - 600mA CMOS LDO Regulator w/ Enable The AP2112 is CMOS process low dropout linear regulator with enable function, the regulator delivers a guaranteed 600mA (min.) continuous load current. Features Output Voltage Accuracy: ±1.5% Output Current: 600mA (Min.) Foldback Short Current Protection: 50mA Enable Function to Turn ON/OFF VOUT Low Dropout Voltage (3.3V): 250mV (Typ.) @IOUT=600mA Excellent Load Regulation: 0.2%/A (Typ.) Excellent Line Regulation: 0.02%/V (Typ.) Low Quiescent Current: 55μA (Typ.) Low Standby Current: 0.01μA (Typ.) Low Output Noise: 50μVRMS PSRR: 100Hz -65dB, 1kHz -65dB OTSD Protection Stable with 1.0μF Flexible Cap: Ceramic, Tantalum and Aluminum Electrolytic Operation Temperature Range: -40°C to 85°C ESD: MM 400V, HBM 4000V; PROD_ID: VREG-12457; VALUE: 3.3V
U3 = SparkFun-GPS:U-BLOX_ZED-F9P; PROD_ID: IC-14209
U4 = SparkFun-IC-Power:STLQ015: STLQ015 - 150mA CMOS LDO Regulator w/ Enable 1.4uA quiescent; PROD_ID: IC-15779
U5 = SparkFun-RF:ESP-WROOM-32: ESP-WROOM-32D - trace antenna (includes keepout) ESP-WROOM-32U - U.FL antenna connector Includes both "standard" footprints and "narrow" version (for use with tighter layouts).; PROD_ID: IC-15676
U6 = SparkFun-IC-Comms:CH340C; PROD_ID: IC-14038
U7 = SparkFun-IC-Power:MAX17048: Micropower 1-Cell Li+ ModelGauge SparkFun Products Qduino Mini (DEV-13614); PROD_ID: IC-12551
U8 = USB251xB:USB251XB; PROD_ID: IC-15827
U9 = SparkFun-GPS:U-BLOX_NEO-D9S: u-blox NEO-D9S The NEO-D9S can receive the data stream of a GNSS correction service, broadcast via satellite L band and compliant to the specification the product is designed for. Integrated with a high precision GNSS receiver, such as from the u-blox F9 platform, it enables the positioning system to reach down to centimeter-level accuracy.; PROD_ID: IC-16579
U10 = SparkFun-IC-Power:MCP73833; PROD_ID: IC-19890
U13 = SparkFun-RF:POWER-DIVIDER: The PD0922J5050S2HF is a low profile, sub-miniature Wilkinson power divider in an easy to use surface mount package. The PD0922J5050S2HF is matched to 50 Ω and has a height profile of 0.5 mm which is ideal for high level integrations in the following markets: DVB-S, DVB-H (USA), GSM, DCS, PCS, CDMA, 3G and GPS. The PD0922J5050S2HF does not include the resistive element and therefore, requires an external resistor for operation.; DIGI-KEY_PART_NUMBER_1: 1173-1094-2-ND; MANUFACTURER_PART_NUMBER: PD0922J5050S2HF; PROD_ID: IC-16658
U$2 = SparkFun-Aesthetics:SPECIAL_INSTRUCTIONS: Special Ordering/Production Instructions Alert Symbol for special PCB ordering instructions or unique production process warnings. Ordering Instructions Production Instructions Types of information that should be added to box: Copper weight Soldermask color Silk color PCB thickness Number of layers PCB Standard: 1.6mm FR4 1 oz copper immersion silver plating red soldermask white silkscreen Types of information that should be added to box: Special wash requirements Depaneling instructions Humidification Glue curing Default text settings: 0.07 inch 9% ratio 50% line distance
Y1 = SparkFun-Clocks:CRYSTAL-24MHZ: 24MHz Crystal Datasheet <http://www.sparkfun.com/datasheets/Components/AT-SMD-5x3.pdf> Frequency: 24MHz Frequency Tolerance: ±20ppm Load Capacitance: 12pF SparkFun Products: USB Bit Whacker <https://www.sparkfun.com/products/762>; PROD_ID: XTAL-14845

## Net classes
0 default: width 0.127 mm
1 power: width 0.178 mm
2 supply: width 0.406 mm
3 RF: width 0.33 mm
4 USB: width 0.203 mm, clearance 0.127 mm